# Altium schematic sheet Tor antenowy.SchDoc (part 1 of 2)
size A3
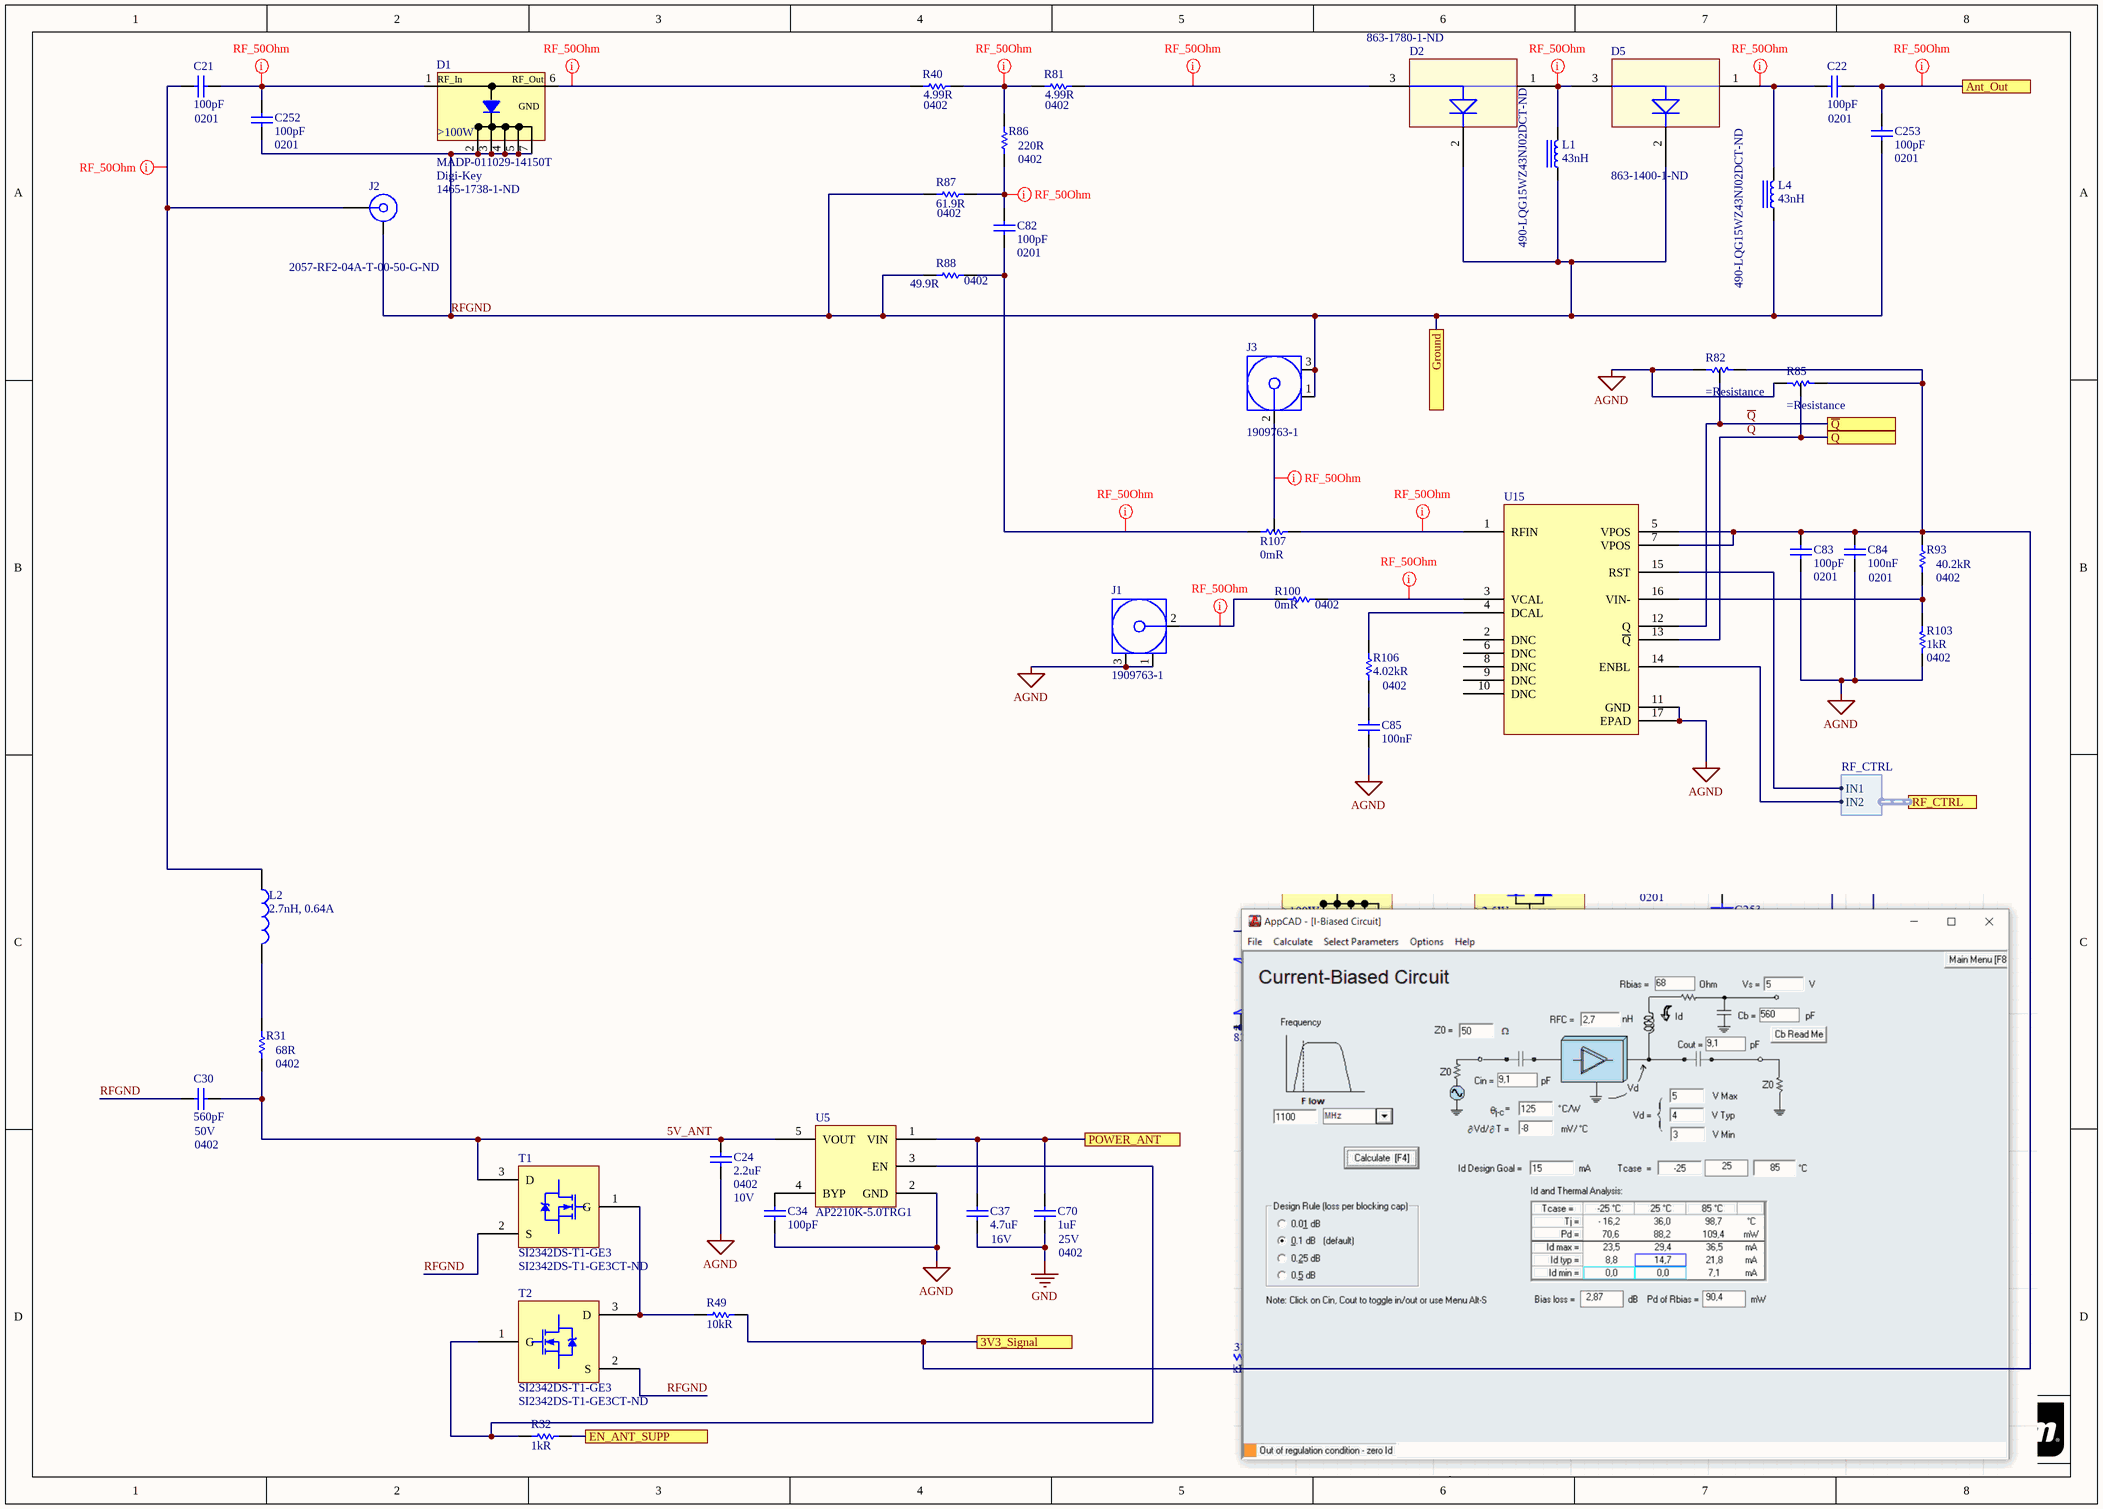
[diagram p0: Tor antenowy.SchDoc]

## Parts
C21  100pF  Case/Package: 0201  [CAP 0201/0603 KK]
C22  100pF  Case/Package: 0201  [CAP 0201/0603 KK]
C24  2.2uF  Case Code (Imperial): 0402  Voltage Rating (DC): 10V  [CAP 0402/1005 RF KK]
C30  560pF  Case/Package: 0402  Voltage Rating: 50V  [CAP 0402/1005 RF KK]
C34  100pF  [CAP 0402/1005 RF KK]
C37  4.7uF  Voltage: 16V  [CAP 0603/1608 RF]
C70  1uF  Case/Package: 0402  Voltage Rating: 25V  [CAP 0402/1005 RF KK]
C82  100pF  Case/Package: 0201  [CAP 0201/0603 KK]
C83  100pF  Case/Package: 0201  [CAP 0201/0603 KK]
C84  100nF  Case/Package: 0201  [CAP 0201/0603 KK]
C85  100nF  [CAP 0201/0603 KK]
C252  100pF  Case/Package: 0201  [CAP 0201/0603 KK]
C253  100pF  Case/Package: 0201  [CAP 0201/0603 KK]
D1  MADP-011029-14150T  Supplier 1: Digi-Key  Supplier Part Number 1: 1465-1738-1-ND  [ODS-1415]
D2  Supplier Part Number 1: 863-1780-1-ND  [CLA4611-085LF]  (hidden comment: CLA4611-085LF)
D5  Supplier Part Number 1: 863-1400-1-ND  [CLA4611-085LF]  (hidden comment: CLA4603-085LF)
J1  1909763-1  [TECO-1909763-1_V]
J2  Supplier Part Number 1: 2057-RF2-04A-T-00-50-G-ND  [ROS-32K101-400L5_V]  (hidden comment: 32K101-400L5)
J3  1909763-1  [TECO-1909763-1_V]
L1  43nH  Supplier Part Number 1: 490-LQG15WZ43NJ02DCT-ND  [IND 0402/1005 RF WW]
L2  2.7nH, 0.64A  [WE-KI_0402]
L4  43nH  Supplier Part Number 1: 490-LQG15WZ43NJ02DCT-ND  [IND 0402/1005 RF WW]
R31  68R  Case/Package: 0402  [RES 0402/1005 RF KK]
R32  1kR  [RES 0402/1005 RF KK]
R40  4.99R  Case/Package: 0402  [RES 0402/1005 RF KK]
R49  10kR  [RES 0402/1005 RF KK]
R81  4.99R  Case/Package: 0402  [RES 0402/1005 RF KK]
R82  (no value)  [RES 0402/1005 RF - 3-PADS]
R85  (no value)  [RES 0402/1005 RF - 3-PADS]
R86  220R  Case/Package: 0402  [RES 0402/1005 RF KK]
R87  61.9R  Case/Package: 0402  [RES 0402/1005 RF KK]
R88  49.9R  Case/Package: 0402  [RES 0402/1005 RF KK]
R93  40.2kR  Case/Package: 0402  [RES 0402/1005 RF KK]
R100  0mR  Case/Package: 0402  [RES 0402/1005 RF KK]
R103  1kR  Case/Package: 0402  [RES 0402/1005 RF KK]
R106  4.02kR  Case/Package: 0402  [RES 0402/1005 RF KK]
R107  0mR  [RES 0402/1005 RF - 3-PADS]
T1  SI2342DS-T1-GE3  Supplier Part Number 1: SI2342DS-T1-GE3CT-ND  [SI2342DS-T1-GE3]
T2  SI2342DS-T1-GE3  Supplier Part Number 1: SI2342DS-T1-GE3CT-ND  [SI2342DS-T1-GE3]
U5  AP2210K-5.0TRG1  [AP2210K-3.3TRG1]
U15  ADL5910ACPZN-R7  [ADL5910]  (value not drawn)

## Ports
3V3_Signal, Ant_Out, EN_ANT_SUPP, Ground, POWER_ANT, Q, RF_CTRL (harness RF_CTRL), ~{Q}

## Harnesses
RF_CTRL: IN1, IN2

## Nets
AGND: C24.1 C34.1 C83.2 C84.1 C85.1 J1.1 J1.3 R82.1 R85.1 R103.2 U5.2(GND) U15.11(GND) U15.17(EPAD)
GND: C37.1 C70.1
3V3_Signal: C83.1 C84.2 R49.1 R82.2 R85.2 R93.2 U15.5(VPOS) U15.7(VPOS) ; port 3V3_Signal
5V_ANT: C24.2 C30.2 R31.1 T1.3(D) U5.5(VOUT)
Ant_Out: C22.2 C253.2 ; port Ant_Out
EN_ANT_SUPP: R32.1 ; port EN_ANT_SUPP
POWER_ANT: C37.2 C70.2 U5.1(VIN) ; port POWER_ANT
Q: R85.3 U15.13(~{Q}) ; port Q
~{Q}: R82.3 U15.12(Q) ; port ~{Q}
RFGND: C30.1 C252.1 C253.1 D1.2(GND) D1.3(GND) D1.4(GND) D1.5(GND) D1.7(GND) D2.2(GND) D5.2(GND) J2.MH J3.1 J3.3 L1.1 L4.1 R87.1 R88.2 T1.2(S) T2.2(S) ; port Ground
NetC21_1: C21.1 J2.1 L2.1
NetC21_2: C21.2 C252.2 D1.1(RF_In)
NetC22_1: C22.1 D5.1 L4.2
NetC34_2: C34.2 U5.4(BYP)
NetC82_1: C82.1 R88.1 R107.1
NetC82_2: C82.2 R86.2 R87.2
NetC85_2: C85.2 R106.1
NetD1_6: D1.6(RF_Out) R40.1
NetD2_1: D2.1 D5.3 L1.2
NetD2_3: D2.3 R81.2
NetJ1_2: J1.2 R100.1
NetJ3_2: J3.2 R107.3
NetL2_2: L2.2 R31.2
NetR32_2: R32.2 T2.1(G) U5.3(EN)
NetR40_2: R40.2 R81.1 R86.1
NetR49_2: R49.2 T1.1(G) T2.3(D)
NetR93_1: R93.1 R103.1 U15.16(VIN-)
NetR100_2: R100.2 U15.3(VCAL)
NetR106_2: R106.2 U15.4(DCAL)
NetR107_2: R107.2 U15.1(RFIN)
NetU15_14: U15.14(ENBL) ; port RF_CTRL.IN2
NetU15_15: U15.15(RST) ; port RF_CTRL.IN1

Not connected (* = marked no-connect by the designer): U15 2(DNC) 6(DNC) 8(DNC) 9(DNC) 10(DNC)

## Layout directives
net class Single50: Ant_Out, NetC21_1, NetC21_2, NetC22_1, NetC82_1, NetC82_2, NetD1_6, NetD2_1, NetD2_3, NetJ1_2, NetJ3_2, NetR40_2, NetR100_2, NetR107_2

## Notes on the sheet
- Title
- Size:
- Date:
- A3
- Number:
- Time:
- Revision:
- Sheet
- of
- File:
- (in symbol MADP-011029-14150T) >100W